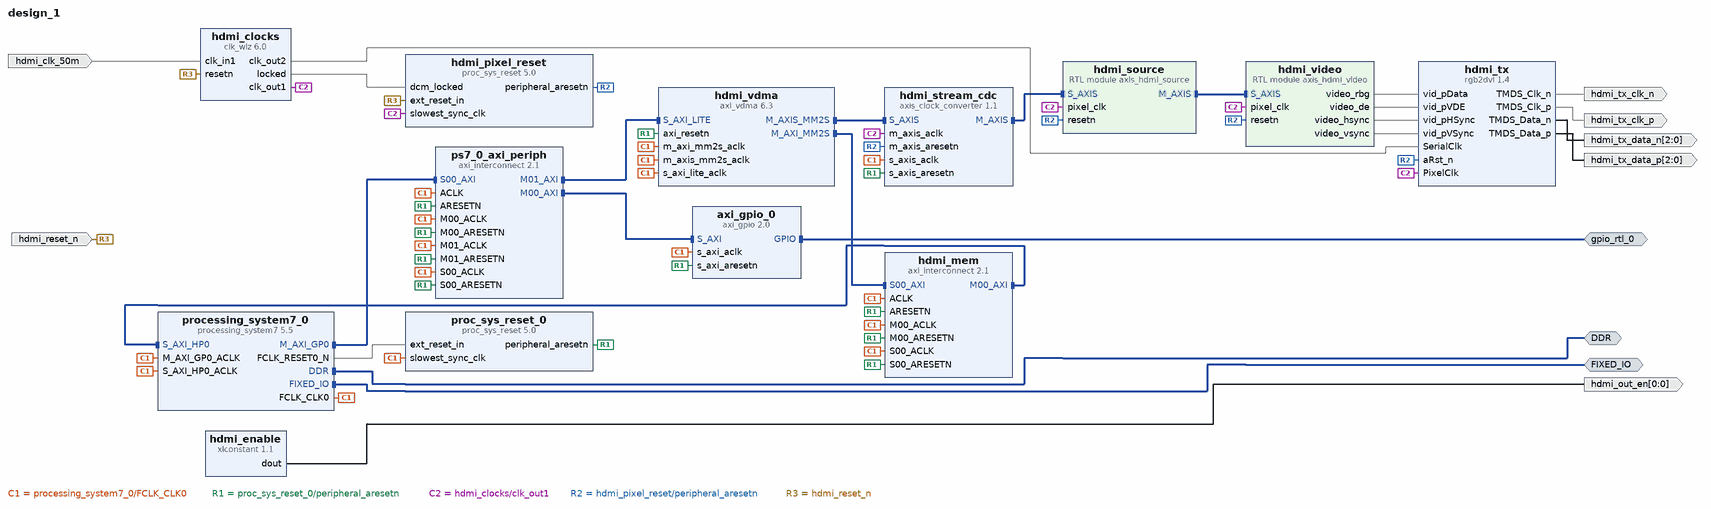
[diagram p0: block diagram of the top level]
# Vivado block design design_1, xc7z020clg400-2, Vivado 2018.3
create_bd_design design_1

create_bd_intf_port -mode Master -vlnv xilinx.com:interface:ddrx_rtl:1.0 DDR
create_bd_intf_port -mode Master -vlnv xilinx.com:display_processing_system7:fixedio_rtl:1.0 FIXED_IO
create_bd_intf_port -mode Master -vlnv xilinx.com:interface:gpio_rtl:1.0 gpio_rtl_0
create_bd_port -dir O hdmi_tx_clk_p
create_bd_port -dir O hdmi_tx_clk_n
create_bd_port -dir O -from 2 -to 0 hdmi_tx_data_p
create_bd_port -dir O -from 2 -to 0 hdmi_tx_data_n
create_bd_port -dir I -type clk hdmi_clk_50m
set_property -dict {CONFIG.FREQ_HZ 50000000} [get_bd_ports hdmi_clk_50m]
create_bd_port -dir I -type rst hdmi_reset_n
set_property -dict {CONFIG.POLARITY ACTIVE_LOW} [get_bd_ports hdmi_reset_n]
create_bd_port -dir O -from 0 -to 0 hdmi_out_en

create_bd_cell -type ip -vlnv xilinx.com:ip:processing_system7:5.5 processing_system7_0
set_property -dict [list \
  CONFIG.PCW_ENET0_ENET0_IO {MIO 16 .. 27} \
  CONFIG.PCW_ENET0_GRP_MDIO_ENABLE 1 \
  CONFIG.PCW_ENET0_GRP_MDIO_IO {MIO 52 .. 53} \
  CONFIG.PCW_ENET0_PERIPHERAL_ENABLE 1 \
  CONFIG.PCW_ENET0_RESET_ENABLE 0 \
  CONFIG.PCW_ENET_RESET_ENABLE 1 \
  CONFIG.PCW_ENET_RESET_SELECT {Share reset pin} \
  CONFIG.PCW_FPGA0_PERIPHERAL_FREQMHZ 100 \
  CONFIG.PCW_GPIO_EMIO_GPIO_ENABLE 1 \
  CONFIG.PCW_GPIO_EMIO_GPIO_IO 64 \
  CONFIG.PCW_GPIO_MIO_GPIO_ENABLE 1 \
  CONFIG.PCW_GPIO_MIO_GPIO_IO MIO \
  CONFIG.PCW_I2C_RESET_ENABLE 1 \
  CONFIG.PCW_PRESET_BANK1_VOLTAGE {LVCMOS 1.8V} \
  CONFIG.PCW_SD0_GRP_CD_ENABLE 0 \
  CONFIG.PCW_SD0_GRP_WP_ENABLE 0 \
  CONFIG.PCW_SD0_PERIPHERAL_ENABLE 1 \
  CONFIG.PCW_SD0_SD0_IO {MIO 40 .. 45} \
  CONFIG.PCW_SDIO_PERIPHERAL_FREQMHZ 100 \
  CONFIG.PCW_UART1_PERIPHERAL_ENABLE 1 \
  CONFIG.PCW_UART1_UART1_IO {MIO 48 .. 49} \
  CONFIG.PCW_UART_PERIPHERAL_FREQMHZ 100 \
  CONFIG.PCW_UIPARAM_DDR_BUS_WIDTH {16 Bit} \
  CONFIG.PCW_UIPARAM_DDR_PARTNO {MT41K256M16 RE-125} \
  CONFIG.PCW_USB_RESET_ENABLE 1 \
  CONFIG.PCW_USE_S_AXI_HP0 1 \
] [get_bd_cells processing_system7_0]
# 210 more settings of processing_system7_0 are not shown: defaults, MIO pin electricals, DDR timing, and values the tool derives
create_bd_cell -type ip -vlnv xilinx.com:ip:proc_sys_reset:5.0 proc_sys_reset_0
create_bd_cell -type ip -vlnv xilinx.com:ip:axi_gpio:2.0 axi_gpio_0
set_property -dict {CONFIG.C_ALL_OUTPUTS 1 CONFIG.C_GPIO_WIDTH 1} [get_bd_cells axi_gpio_0]
create_bd_cell -type ip -vlnv xilinx.com:ip:axi_interconnect:2.1 ps7_0_axi_periph
set_property -dict {CONFIG.NUM_MI 2} [get_bd_cells ps7_0_axi_periph]
create_bd_cell -type ip -vlnv xilinx.com:ip:axi_vdma:6.3 hdmi_vdma
set_property -dict [list \
  CONFIG.c_include_internal_genlock 0 \
  CONFIG.c_include_mm2s_dre 0 \
  CONFIG.c_include_s2mm 0 \
  CONFIG.c_include_sg 0 \
  CONFIG.c_m_axi_mm2s_data_width 64 \
  CONFIG.c_m_axis_mm2s_tdata_width 32 \
  CONFIG.c_mm2s_genlock_mode 0 \
  CONFIG.c_mm2s_linebuffer_depth 4096 \
  CONFIG.c_mm2s_max_burst_length 16 \
  CONFIG.c_num_fstores 1 \
  CONFIG.c_use_fsync 0 \
] [get_bd_cells hdmi_vdma]
create_bd_cell -type ip -vlnv xilinx.com:ip:axi_interconnect:2.1 hdmi_mem
set_property -dict {CONFIG.NUM_MI 1 CONFIG.NUM_SI 1} [get_bd_cells hdmi_mem]
create_bd_cell -type ip -vlnv xilinx.com:ip:clk_wiz:6.0 hdmi_clocks
set_property -dict [list \
  CONFIG.CLKOUT1_REQUESTED_OUT_FREQ 74.2 \
  CONFIG.CLKOUT2_REQUESTED_OUT_FREQ 371.25 \
  CONFIG.CLKOUT2_USED true \
  CONFIG.PRIM_IN_FREQ 50.000 \
  CONFIG.PRIM_SOURCE Single_ended_clock_capable_pin \
  CONFIG.RESET_TYPE ACTIVE_LOW \
] [get_bd_cells hdmi_clocks]
create_bd_cell -type ip -vlnv xilinx.com:ip:proc_sys_reset:5.0 hdmi_pixel_reset
create_bd_cell -type ip -vlnv digilentinc.com:ip:rgb2dvi:1.4 hdmi_tx
set_property -dict {CONFIG.kGenerateSerialClk false CONFIG.kRstActiveHigh false} [get_bd_cells hdmi_tx]
create_bd_cell -type ip -vlnv xilinx.com:ip:axis_clock_converter:1.1 hdmi_stream_cdc
set_property -dict [list \
  CONFIG.HAS_TLAST 1 \
  CONFIG.IS_ACLK_ASYNC 1 \
  CONFIG.TDATA_NUM_BYTES 4 \
  CONFIG.TUSER_WIDTH 1 \
] [get_bd_cells hdmi_stream_cdc]
create_bd_cell -type module -reference axis_hdmi_source hdmi_source
set_property -dict {CONFIG.H_ACTIVE 1280 CONFIG.TEST_PATTERN 0 CONFIG.V_ACTIVE 720} [get_bd_cells hdmi_source]
create_bd_cell -type module -reference axis_hdmi_video hdmi_video
set_property -dict [list \
  CONFIG.H_ACTIVE 1280 \
  CONFIG.H_BP 220 \
  CONFIG.H_FP 110 \
  CONFIG.H_SYNC 40 \
  CONFIG.SYNC_POSITIVE 1 \
  CONFIG.V_ACTIVE 720 \
  CONFIG.V_BP 20 \
  CONFIG.V_FP 5 \
  CONFIG.V_SYNC 5 \
] [get_bd_cells hdmi_video]
create_bd_cell -type ip -vlnv xilinx.com:ip:xlconstant:1.1 hdmi_enable
set_property -dict {CONFIG.CONST_VAL 1 CONFIG.CONST_WIDTH 1} [get_bd_cells hdmi_enable]

# ---- connections ----

connect_bd_intf_net [get_bd_intf_ports DDR] [get_bd_intf_pins processing_system7_0/DDR]
connect_bd_intf_net [get_bd_intf_pins hdmi_stream_cdc/M_AXIS] [get_bd_intf_pins hdmi_source/S_AXIS]
connect_bd_intf_net [get_bd_intf_pins hdmi_source/M_AXIS] [get_bd_intf_pins hdmi_video/S_AXIS]
connect_bd_intf_net [get_bd_intf_pins hdmi_mem/M00_AXI] [get_bd_intf_pins processing_system7_0/S_AXI_HP0]
connect_bd_intf_net [get_bd_intf_pins ps7_0_axi_periph/M01_AXI] [get_bd_intf_pins hdmi_vdma/S_AXI_LITE]
connect_bd_intf_net [get_bd_intf_pins hdmi_vdma/M_AXIS_MM2S] [get_bd_intf_pins hdmi_stream_cdc/S_AXIS]
connect_bd_intf_net [get_bd_intf_pins hdmi_vdma/M_AXI_MM2S] [get_bd_intf_pins hdmi_mem/S00_AXI]
connect_bd_intf_net [get_bd_intf_ports gpio_rtl_0] [get_bd_intf_pins axi_gpio_0/GPIO]
connect_bd_intf_net [get_bd_intf_pins ps7_0_axi_periph/M00_AXI] [get_bd_intf_pins axi_gpio_0/S_AXI]
connect_bd_intf_net [get_bd_intf_ports FIXED_IO] [get_bd_intf_pins processing_system7_0/FIXED_IO]
connect_bd_intf_net [get_bd_intf_pins processing_system7_0/M_AXI_GP0] [get_bd_intf_pins ps7_0_axi_periph/S00_AXI]
connect_bd_net [get_bd_pins processing_system7_0/FCLK_CLK0] \
  [get_bd_pins proc_sys_reset_0/slowest_sync_clk] [get_bd_pins processing_system7_0/M_AXI_GP0_ACLK] \
  [get_bd_pins ps7_0_axi_periph/S00_ACLK] [get_bd_pins axi_gpio_0/s_axi_aclk] [get_bd_pins ps7_0_axi_periph/M00_ACLK] \
  [get_bd_pins ps7_0_axi_periph/ACLK] [get_bd_pins hdmi_vdma/s_axi_lite_aclk] [get_bd_pins hdmi_vdma/m_axi_mm2s_aclk] \
  [get_bd_pins hdmi_mem/ACLK] [get_bd_pins hdmi_mem/S00_ACLK] [get_bd_pins hdmi_mem/M00_ACLK] \
  [get_bd_pins processing_system7_0/S_AXI_HP0_ACLK] [get_bd_pins ps7_0_axi_periph/M01_ACLK] \
  [get_bd_pins hdmi_vdma/m_axis_mm2s_aclk] [get_bd_pins hdmi_stream_cdc/s_axis_aclk]
connect_bd_net [get_bd_pins proc_sys_reset_0/peripheral_aresetn] \
  [get_bd_pins ps7_0_axi_periph/S00_ARESETN] [get_bd_pins axi_gpio_0/s_axi_aresetn] \
  [get_bd_pins ps7_0_axi_periph/M00_ARESETN] [get_bd_pins ps7_0_axi_periph/ARESETN] [get_bd_pins hdmi_vdma/axi_resetn] \
  [get_bd_pins hdmi_mem/ARESETN] [get_bd_pins hdmi_mem/S00_ARESETN] [get_bd_pins hdmi_mem/M00_ARESETN] \
  [get_bd_pins ps7_0_axi_periph/M01_ARESETN] [get_bd_pins hdmi_stream_cdc/s_axis_aresetn]
connect_bd_net [get_bd_pins processing_system7_0/FCLK_RESET0_N] [get_bd_pins proc_sys_reset_0/ext_reset_in]
connect_bd_net [get_bd_pins hdmi_clocks/clk_out1] \
  [get_bd_pins hdmi_pixel_reset/slowest_sync_clk] [get_bd_pins hdmi_tx/PixelClk] [get_bd_pins hdmi_stream_cdc/m_axis_aclk] \
  [get_bd_pins hdmi_source/pixel_clk] [get_bd_pins hdmi_video/pixel_clk]
connect_bd_net [get_bd_pins hdmi_clocks/clk_out2] [get_bd_pins hdmi_tx/SerialClk]
connect_bd_net [get_bd_pins hdmi_clocks/locked] [get_bd_pins hdmi_pixel_reset/dcm_locked]
connect_bd_net [get_bd_pins hdmi_pixel_reset/peripheral_aresetn] \
  [get_bd_pins hdmi_tx/aRst_n] [get_bd_pins hdmi_stream_cdc/m_axis_aresetn] [get_bd_pins hdmi_source/resetn] \
  [get_bd_pins hdmi_video/resetn]
connect_bd_net [get_bd_pins hdmi_video/video_rbg] [get_bd_pins hdmi_tx/vid_pData]
connect_bd_net [get_bd_pins hdmi_video/video_de] [get_bd_pins hdmi_tx/vid_pVDE]
connect_bd_net [get_bd_pins hdmi_video/video_hsync] [get_bd_pins hdmi_tx/vid_pHSync]
connect_bd_net [get_bd_pins hdmi_video/video_vsync] [get_bd_pins hdmi_tx/vid_pVSync]
connect_bd_net [get_bd_pins hdmi_tx/TMDS_Clk_p] [get_bd_ports hdmi_tx_clk_p]
connect_bd_net [get_bd_pins hdmi_tx/TMDS_Clk_n] [get_bd_ports hdmi_tx_clk_n]
connect_bd_net [get_bd_pins hdmi_tx/TMDS_Data_p] [get_bd_ports hdmi_tx_data_p]
connect_bd_net [get_bd_pins hdmi_tx/TMDS_Data_n] [get_bd_ports hdmi_tx_data_n]
connect_bd_net [get_bd_ports hdmi_clk_50m] [get_bd_pins hdmi_clocks/clk_in1]
connect_bd_net [get_bd_ports hdmi_reset_n] [get_bd_pins hdmi_clocks/resetn] [get_bd_pins hdmi_pixel_reset/ext_reset_in]
connect_bd_net [get_bd_pins hdmi_enable/dout] [get_bd_ports hdmi_out_en]

# ---- address map ----
assign_bd_address -offset 0x00000000 -range 512M -target_address_space [get_bd_addr_spaces hdmi_vdma/Data_MM2S] [get_bd_addr_segs processing_system7_0/S_AXI_HP0/HP0_DDR_LOWOCM]
assign_bd_address -offset 0x41200000 -range 64K -target_address_space [get_bd_addr_spaces processing_system7_0/Data] [get_bd_addr_segs axi_gpio_0/S_AXI/Reg]
assign_bd_address -offset 0x43000000 -range 64K -target_address_space [get_bd_addr_spaces processing_system7_0/Data] [get_bd_addr_segs hdmi_vdma/S_AXI_LITE/Reg]

validate_bd_design
save_bd_design
